# Altium project PSOC.PrjPcb
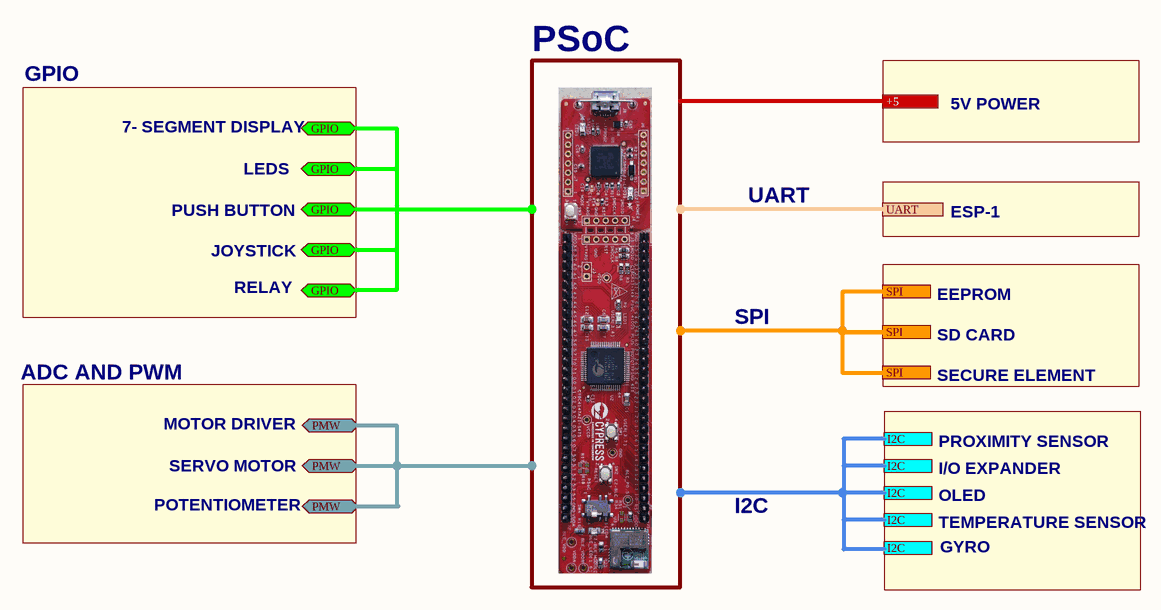
[diagram p0: Block_Diagram.SchDoc]
5 sheets, 139 parts. Net scope: global (net labels, ports and power ports of the same name join across sheets).
Board file: PSOC_LAY.PcbDoc
Sheets:
  Block_Diagram.SchDoc
  PSOC_ControllerSchDoc.SchDoc
  PSOC_I2C_BUS.SchDoc
  PSOC_SPI_BUS.SchDoc
  PSOC_PERI_2.SchDoc

## Sheet Block_Diagram.SchDoc
size A4; SheetNumber: 1; SheetTotal: 7

### Ports
+5, GPIO (bidir, see Block_Diagram[2B]), GPIO (bidir, see Block_Diagram[2B], Block_Diagram[2C]), I2C (see Block_Diagram[3C]), I2C (see Block_Diagram[3C], Block_Diagram[3D]), PMW (bidir, see Block_Diagram[2C]), SPI (see Block_Diagram[3C]), UART

### Notes on the sheet
- GPIO
- PSoC
- 7- SEGMENT DISPLAY
- 5V POWER
- PUSH BUTTON
- LEDS
- UART
- ESP-1
- JOYSTICK
- RELAY
- SPI
- EEPROM
- SD CARD
- ADC AND PWM
- SECURE ELEMENT
- MOTOR DRIVER
- SERVO MOTOR
- PROXIMITY SENSOR
- I/O EXPANDER
- POTENTIOMETER
- I2C
- OLED
- TEMPERATURE SENSOR
- GYRO

## Sheet PSOC_ControllerSchDoc.SchDoc
size A3; SheetNumber: 3; SheetTotal: 7
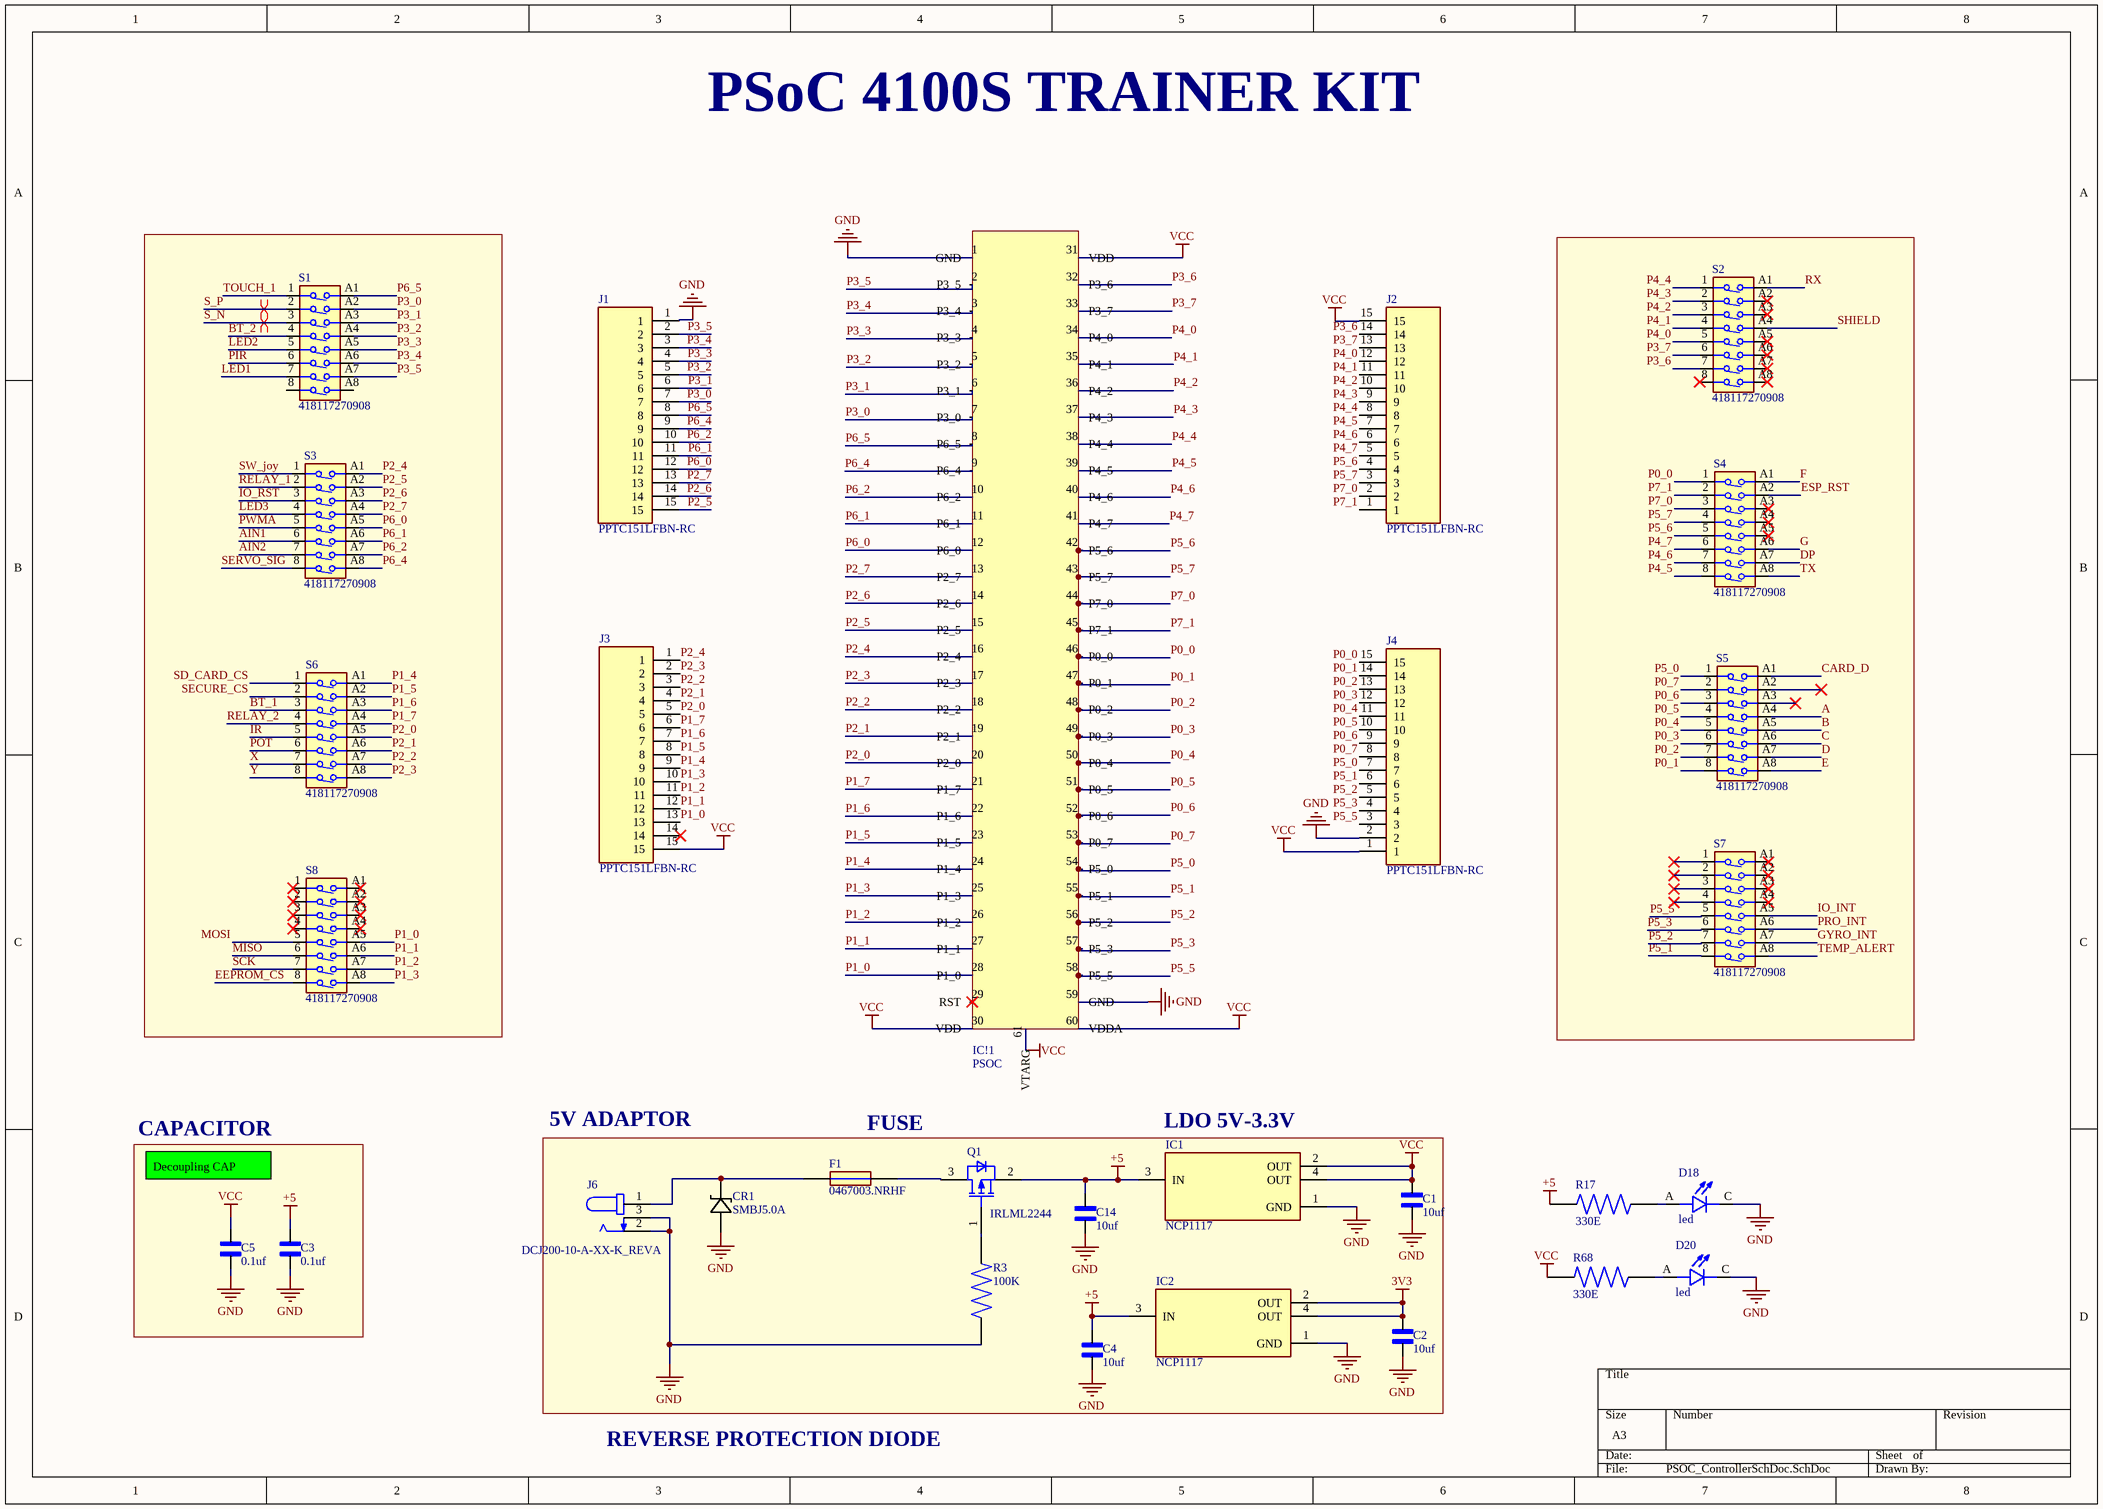
[diagram p1: PSOC_ControllerSchDoc.SchDoc]

### Parts
C1  10uf  [CAPC3216X229N]
C2  10uf  [CAPC3216X229N]
C3  0.1uf  [CAPC1005X55N]
C4  10uf  [CAPC3216X229N]
C5  0.1uf  [CAPC1005X55N]
C14  10uf  [CAPC3216X229N]
CR1  SMBJ5.0A  [DO-214AASMB_J-BEND_LTF]
D18  led  [LEDC2012X120N]
D20  led  [LEDC2012X120N]
F1  0467003.NRHF  [FUSC1608X43N]
IC1  NCP1117  [SOT223-3]
IC2  NCP1117  [SOT223-3]
IC!1  PSOC  [PCBComponent_1]
J1  PPTC151LFBN-RC  [RHDR15W85P0X254_1X15_3708X254X850P]
J2  PPTC151LFBN-RC  [RHDR15W85P0X254_1X15_3708X254X850P]
J3  PPTC151LFBN-RC  [RHDR15W85P0X254_1X15_3708X254X850P]
J4  PPTC151LFBN-RC  [RHDR15W85P0X254_1X15_3708X254X850P]
J6  DCJ200-10-A-XX-K_REVA  [GCT_DCJ200-10-A-XX-K_REVA]
Q1  IRLML2244  [SOT95P230X110-3N]
R3  100K  [RESC1005X40N]
R17  330E  [RESC1005X40N]
R68  330E  [RESC1005X40N]
S1  418117270908  [418117270908]
S2  418117270908  [418117270908]
S3  418117270908  [418117270908]
S4  418117270908  [418117270908]
S5  418117270908  [418117270908]
S6  418117270908  [418117270908]
S7  418117270908  [418117270908]
S8  418117270908  [418117270908]

### Blocks framed on the sheet
CAPACITOR: C3 C5

### Nets
3V3: C2.2 IC2.2(OUT) IC2.4(OUT)
+5: C3.1 C4.2 C14.2 IC1.3(IN) IC2.3(IN) Q1.2(SOURCE) R17.2
GND: C1.1 C2.1 C3.2 C4.1 C5.2 C14.1 CR1.2(ANODE) D18.C D20.C IC1.1(GND) IC2.1(GND) IC!1.1(GND) IC!1.59(GND) J1.1 J4.2 J6.2 J6.3 R3.2
VCC: C1.2 C5.1 IC1.2(OUT) IC1.4(OUT) IC!1.30(VDD) IC!1.31(VDD) IC!1.60(VDDA) IC!1.61(VTARG) J2.15 J3.15 J4.1 R68.2
A: S5.A4
AIN1: S3.6
AIN2: S3.7
B: S5.A5
BT_1: S6.3
BT_2: S1.4
C: S5.A6
CARD_D: S5.A1
D: S5.A7
DP: S4.A7
E: S5.A8
EEPROM_CS: S8.8
ESP_RST: S4.A2
F: S4.A1
G: S4.A6
GYRO_INT: S7.A7
IO_INT: S7.A5
IO_RST: S3.3
IR: S6.5
LED1: S1.7
LED2: S1.5
LED3: S3.4
MISO: S8.6
MOSI: S8.5
P0_0: IC!1.46(P0_0) J4.15 S4.1
P0_1: IC!1.47(P0_1) J4.14 S5.8
P0_2: IC!1.48(P0_2) J4.13 S5.7
P0_3: IC!1.49(P0_3) J4.12 S5.6
P0_4: IC!1.50(P0_4) J4.11 S5.5
P0_5: IC!1.51(P0_5) J4.10 S5.4
P0_6: IC!1.52(P0_6) J4.9 S5.3
P0_7: IC!1.53(P0_7) J4.8 S5.2
P1_0: IC!1.28(P1_0) J3.13 S8.A5
P1_1: IC!1.27(P1_1) J3.12 S8.A6
P1_2: IC!1.26(P1_2) J3.11 S8.A7
P1_3: IC!1.25(P1_3) J3.10 S8.A8
P1_4: IC!1.24(P1_4) J3.9 S6.A1
P1_5: IC!1.23(P1_5) J3.8 S6.A2
P1_6: IC!1.22(P1_6) J3.7 S6.A3
P1_7: IC!1.21(P1_7) J3.6 S6.A4
P2_0: IC!1.20(P2_0) J3.5 S6.A5
P2_1: IC!1.19(P2_1) J3.4 S6.A6
P2_2: IC!1.18(P2_2) J3.3 S6.A7
P2_3: IC!1.17(P2_3) J3.2 S6.A8
P2_4: IC!1.16(P2_4) J3.1 S3.A1
P2_5: IC!1.15(P2_5) J1.15 S3.A2
P2_6: IC!1.14(P2_6) J1.14 S3.A3
P2_7: IC!1.13(P2_7) J1.13 S3.A4
P3_0: IC!1.7(P3_0) J1.7 S1.A2
P3_1: IC!1.6(P3_1) J1.6 S1.A3
P3_2: IC!1.5(P3_2) J1.5 S1.A4
P3_3: IC!1.4(P3_3) J1.4 S1.A5
P3_4: IC!1.3(P3_4) J1.3 S1.A6
P3_5: IC!1.2(P3_5) J1.2 S1.A7
P3_6: IC!1.32(P3_6) J2.14 S2.7
P3_7: IC!1.33(P3_7) J2.13 S2.6
P4_0: IC!1.34(P4_0) J2.12 S2.5
P4_1: IC!1.35(P4_1) J2.11 S2.4
P4_2: IC!1.36(P4_2) J2.10 S2.3
P4_3: IC!1.37(P4_3) J2.9 S2.2
P4_4: IC!1.38(P4_4) J2.8 S2.1
P4_5: IC!1.39(P4_5) J2.7 S4.8
P4_6: IC!1.40(P4_6) J2.6 S4.7
P4_7: IC!1.41(P4_7) J2.5 S4.6
P5_0: IC!1.54(P5_0) J4.7 S5.1
P5_1: IC!1.55(P5_1) J4.6 S7.8
P5_2: IC!1.56(P5_2) J4.5 S7.7
P5_3: IC!1.57(P5_3) J4.4 S7.6
P5_5: IC!1.58(P5_5) J4.3 S7.5
P5_6: IC!1.42(P5_6) J2.4 S4.5
P5_7: IC!1.43(P5_7) J2.3 S4.4
P6_0: IC!1.12(P6_0) J1.12 S3.A5
P6_1: IC!1.11(P6_1) J1.11 S3.A6
P6_2: IC!1.10(P6_2) J1.10 S3.A7
P6_4: IC!1.9(P6_4) J1.9 S3.A8
P6_5: IC!1.8(P6_5) J1.8 S1.A1
P7_0: IC!1.44(P7_0) J2.2 S4.3
P7_1: IC!1.45(P7_1) J2.1 S4.2
PIR: S1.6
POT: S6.6
PRO_INT: S7.A6
PWMA: S3.5
RELAY_1: S3.2
RELAY_2: S6.4
RX: S2.A1
S_N: S1.3
S_P: S1.2
SCK: S8.7
SD_CARD_CS: S6.1
SECURE_CS: S6.2
SERVO_SIG: S3.8
SHIELD: S2.A4
SW_joy: S3.1
TEMP_ALERT: S7.A8
TOUCH_1: S1.1
TX: S4.A8
X: S6.7
Y: S6.8
NetCR1_1: CR1.1(CATHODE) F1.2 J6.1
NetD18_A: D18.A R17.1
NetD20_A: D20.A R68.1
NetF1_1: F1.1 Q1.3(DRAIN)
NetQ1_1: Q1.1(GATE) R3.1

Not connected (* = marked no-connect by the designer): IC!1 29(RST)*; J3 14*; S1 8 A8; S2 8* A2* A3* A5* A6* A7* A8*; S4 A3* A4* A5*; S5 A2* A3*; S7 1* 2* 3* 4* A1* A2* A3* A4*; S8 1* 2* 3* 4* A1* A2* A3* A4*

### Layout directives
differential pair: S_N, S_P

### Notes on the sheet
- PSoC 4100S TRAINER KIT
- 5V ADAPTOR
- Decoupling CAP
- (near F1) FUSE
- (near IC1) LDO 5V-3.3V
- REVERSE PROTECTION DIODE

### Library data of the parts
C1 C2 C4 C14 = 1206ZD226MAT2A: 0,1 ÂµF Â±%10 16V Seramik KondansatÃ¶r X7R 0402 (1005 Metrik); MF: AVX; SnapEDA_Link: https://www.snapeda.com/parts/1206ZD226MAT2A/AVX/view-part/?ref=snap; Package: 3216 AVX; Value: *; MP: 1206ZD226MAT2A; Check_prices: https://www.snapeda.com/parts/1206ZD226MAT2A/AVX/view-part/?ref=eda
C3 C5 = C0402T104K4RACTU: Cap Ceramic 0.1uF 16V X7R 10% SMD 0402 85Â°C Punched Paper T/R; MF: KEMET; SnapEDA_Link: https://www.snapeda.com/parts/C0402T104K4RACTU/KEMET/view-part/?ref=snap; Package: 0402 KEMET; Value: *; MP: C0402T104K4RACTU; Check_prices: https://www.snapeda.com/parts/C0402T104K4RACTU/KEMET/view-part/?ref=eda
CR1 = SMBJ5.0A: Description; Manufacturer_Name: Littelfuse Inc; Copyright: Copyright (C) 2026 Ultra Librarian. All rights reserved.; Manufacturer_Part_Number: SMBJ5.0A
D18 D20 = SML-LXT0805IW-TR: LED;Red;11mcd;0.061In.Dia.;SMD;100mA;2V Vf;635nm;140deg;SMD;White Diffused;5V Vr | Lumex SML-LXT0805IW-TR; MF: Lumex Opto/Components; SnapEDA_Link: https://www.snapeda.com/parts/SML-LXT0805IW-TR/Lumex+Opto%252FComponents+Inc./view-part/?ref=snap; Package: 0805 Lumex; Value: *; MP: SML-LXT0805IW-TR; Check_prices: https://www.snapeda.com/parts/SML-LXT0805IW-TR/Lumex+Opto%252FComponents+Inc./view-part/?ref=eda
F1 = 0467001.NRHF: Surface Mount Fuses 32V 0603 1A V/FA HALIDE FREE; Manufacturer_Name: LITTELFUSE; Geometry.Height: 0.432mm; Mouser Part Number: 576-0467001.NRHF; Mouser Price/Stock: https://www.mouser.co.uk/ProductDetail/Littelfuse/0467001NRHF?qs=n5MbhIql%252BRmX3ko2b0IFNg%3D%3D; Manufacturer_Part_Number: 0467001.NRHF; Datasheet Link: *
IC1 IC2 = NCP1117: Linear Voltage Regulator IC Positive Fixed 1 Output 1A SOT-223; MF: ON Semiconductor; SnapEDA_Link: https://www.snapeda.com/parts/NCP1117/Onsemi/view-part/?ref=snap; Package: None; Value: *; MP: NCP1117; Check_prices: https://www.snapeda.com/parts/NCP1117/Onsemi/view-part/?ref=eda
J1-J4 = PPTC151LFBN-RC: CONN HDR 15POS 0.1 TIN PCB; Manufacturer_Name: Sullins; Geometry.Height: 8.5mm; Manufacturer_Part_Number: PPTC151LFBN-RC; Mouser Part Number: *; Mouser Price/Stock: *; Arrow Part Number: *; Arrow Price/Stock: *; Datasheet Link: https://www.digikey.com/en/products/detail/sullins-connector-solutions/PPTC151LFBN-RC/810153
J6 = DCJ200-10-A-XX-K_REVA: Power Barrel Connector Jack 2.05mm ID (0.081), 5.50mm OD (0.217) Through Hole, Right Angle; MF: Global Connector Technology; MP: DCJ200-10-A-K1-K; SnapEDA_Link: https://www.snapeda.com/parts/DCJ200-10-A-K1-K/Global+Connector+Technology/view-part/?ref=snap; Package: None; Value: *; Check_prices: https://www.snapeda.com/parts/DCJ200-10-A-K1-K/Global+Connector+Technology/view-part/?ref=eda
Q1 = IRLML2244: Insulated-Gate Field-Effect Transistor (IGFET), P-Channel, Enhancement,  Body Diode, Pin 1 Gate, 2 Source, 3 Drain, 3 Pins; Manufacturer: Infineon Technologies; PackageReference: PG-SOT23-3-901; Manufacturer Order Number: IRLML2244
R3 R17 R68 = RL0402FR-070R1L: 100 mOhms Â±1% 0.063W, 1/16W Chip Resistor 0402 (1005 Metric) Automotive AEC-Q200, Current Sense, Moisture Resistant Thick Film; MF: Yageo; SnapEDA_Link: https://www.snapeda.com/parts/RL0402FR-070R1L/Yageo/view-part/?ref=snap; Package: 0402-2 Yageo; Value: *; MP: RL0402FR-070R1L; Check_prices: https://www.snapeda.com/parts/RL0402FR-070R1L/Yageo/view-part/?ref=eda
S1-S8 = 418117270908: Dip Switch SPST 8 Position Through Hole Slide (Standard) Actuator 25mA 24VDC; MF: WÃ¼rth Elektronik; SnapEDA_Link: https://www.snapeda.com/parts/418117270908/W%25C3%25BCrth+Elektronik+Midcom/view-part/?ref=snap; Package: None; Value: *; MP: 418117270908; Check_prices: https://www.snapeda.com/parts/418117270908/W%25C3%25BCrth+Elektronik+Midcom/view-part/?ref=eda

## Sheet PSOC_I2C_BUS.SchDoc
size A3; SheetNumber: 4; SheetTotal: 7
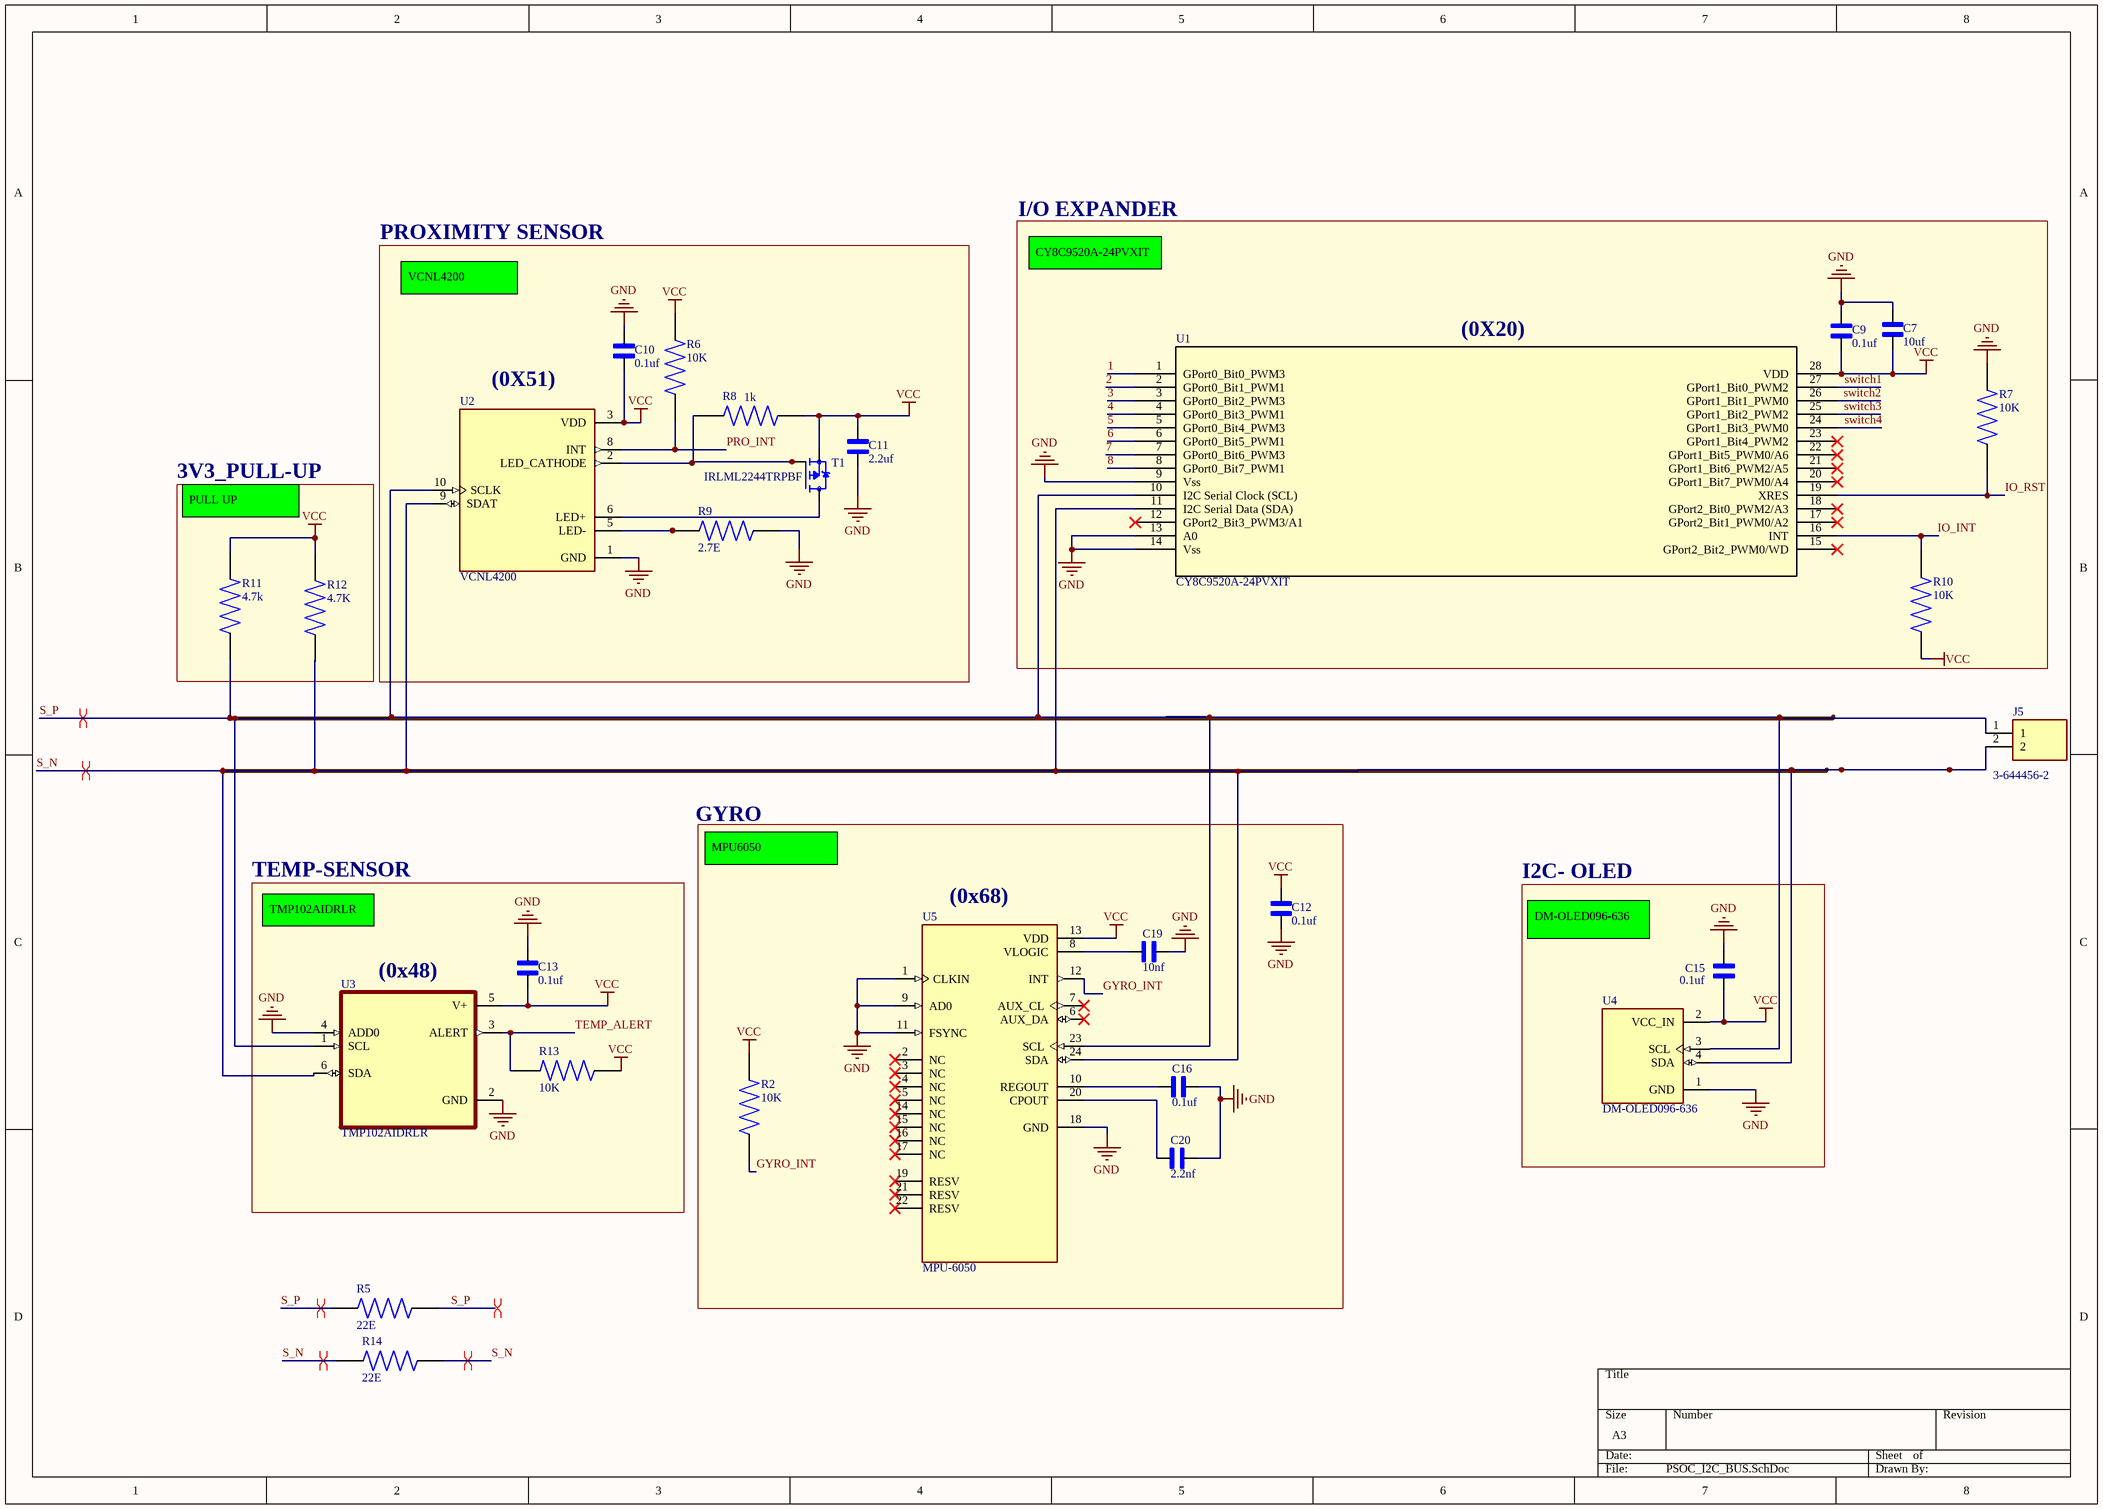
[diagram p2: PSOC_I2C_BUS.SchDoc]

### Parts
C7  10uf  [CAPC3216X229N]
C9  0.1uf  [CAPC1005X55N]
C10  0.1uf  [CAPC1005X55N]
C11  2.2uf  [CAPC1005X55N]
C12  0.1uf  [CAPC1005X55N]
C13  0.1uf  [CAPC1005X55N]
C15  0.1uf  [CAPC1005X55N]
C16  0.1uf  [CAPC1005X55N]
C19  10nf  [CAPC1005X55N]
C20  2.2nf  [CAPC1005X55N]
J5  3-644456-2  [TE_3-644456-2]
R2  10K  [RESC1005X40N]
R5  22E  [RESC1005X40N]
R6  10K  [RESC1005X40N]
R7  10K  [RESC1005X40N]
R8  1k  [RESC1005X40N]
R9  2.7E  [RESC1005X40N]
R10  10K  [RESC1005X40N]
R11  4.7k  [RESC1005X40N]
R12  4.7K  [RESC1005X40N]
R13  10K  [RESC1005X40N]
R14  22E  [RESC1005X40N]
T1  IRLML2244TRPBF  [SOT-23]
U1  CY8C9520A-24PVXIT  [SSOP-28]
U2  VCNL4200  [SENSOR_VCNL4200]
U3  TMP102AIDRLR  [SOT50P160X60-6N]
U4  DM-OLED096-636  [MODULE_DM-OLED096-636]
U5  MPU-6050  [QFN50P400X400X95-24N]

### Blocks framed on the sheet
3V3_PULL-UP: R11 R12
I2C- OLED: C15 U4

### Nets
GND: C7.2 C9.1 C10.1 C11.2 C12.1 C13.1 C15.1 C16.2 C19.2 C20.2 R7.2 R9.2 U1.9(Vss) U1.13(A0) U1.14(Vss) U2.1(GND) U3.2(GND) U3.4(ADD0) U4.1(GND) U5.1(CLKIN) U5.9(AD0) U5.11(FSYNC) U5.18(GND)
VCC: C7.1 C9.2 C10.2 C11.1 C12.2 C13.2 C15.2 R2.2 R6.2 R8.2 R10.1 R11.2 R12.2 R13.2 T1.2(S) U1.28(VDD) U2.3(VDD) U3.5(V+) U4.2(VCC_IN) U5.13(VDD)
1: U1.1(GPort0_Bit0_PWM3)
2: U1.2(GPort0_Bit1_PWM1)
3: U1.3(GPort0_Bit2_PWM3)
4: U1.4(GPort0_Bit3_PWM1)
5: U1.5(GPort0_Bit4_PWM3)
6: U1.6(GPort0_Bit5_PWM1)
7: U1.7(GPort0_Bit6_PWM3)
8: U1.8(GPort0_Bit7_PWM1)
GYRO_INT: R2.1 U5.12(INT)
IO_INT: R10.2 U1.16(INT)
IO_RST: R7.1 U1.19(XRES)
PRO_INT: R6.1 U2.8(INT)
S_N: J5.2 R12.1 R14.1 R14.2 U1.11(I2C_Serial_Data_(SDA)) U2.9(SDAT) U3.6(SDA) U4.4(SDA) U5.24(SDA)
S_P: J5.1 R5.1 R5.2 R11.1 U1.10(I2C_Serial_Clock_(SCL)) U2.10(SCLK) U3.1(SCL) U4.3(SCL) U5.23(SCL)
switch1: U1.27(GPort1_Bit0_PWM2)
switch2: U1.26(GPort1_Bit1_PWM0)
switch3: U1.25(GPort1_Bit2_PWM2)
switch4: U1.24(GPort1_Bit3_PWM0)
TEMP_ALERT: R13.1 U3.3(ALERT)
NetC16_1: C16.1 U5.10(REGOUT)
NetC19_1: C19.1 U5.8(VLOGIC)
NetC20_1: C20.1 U5.20(CPOUT)
NetR8_1: R8.1 T1.1(G) U2.2(LED_CATHODE)
NetR9_1: R9.1 U2.5(LED-)
NetT1_3: T1.3(D) U2.6(LED+)

Not connected (* = marked no-connect by the designer): U1 12(GPort2_Bit3_PWM3/A1)* 15(GPort2_Bit2_PWM0/WD)* 17(GPort2_Bit1_PWM0/A2)* 18(GPort2_Bit0_PWM2/A3)* 20(GPort1_Bit7_PWM0/A4)* 21(GPort1_Bit6_PWM2/A5)* 22(GPort1_Bit5_PWM0/A6)* 23(GPort1_Bit4_PWM2)*; U5 2(NC)* 3(NC)* 4(NC)* 5(NC)* 6(AUX_DA)* 7(AUX_CL)* 14(NC)* 15(NC)* 16(NC)* 17(NC)* 19(RESV)* 21(RESV)* 22(RESV)*

### Layout directives
differential pair: S_N, S_P

### Notes on the sheet
- PROXIMITY SENSOR
- I/O EXPANDER
- VCNL4200
- CY8C9520A-24PVXIT
- (near U1) (0X20)
- (near U2) (0X51)
- PULL UP
- GYRO
- TEMP-SENSOR
- TMP102AIDRLR
- MPU6050
- (near U5) (0x68)
- (near U3) (0x48)
- DM-OLED096-636

### Library data of the parts
C7 = 1206ZD226MAT2A: as C1 on sheet PSOC_ControllerSchDoc; SnapEDA_Link: https://www.snapeda.com/parts/1206ZD226MAT2A/AVX/view-part/?ref=snap; Package: 3216 AVX; Value: *; MP: 1206ZD226MAT2A; Check_prices: https://www.snapeda.com/parts/1206ZD226MAT2A/AVX/view-part/?ref=eda
C9-C13 C15 C16 C19 C20 = C0402T104K4RACTU: as C3 on sheet PSOC_ControllerSchDoc; SnapEDA_Link: https://www.snapeda.com/parts/C0402T104K4RACTU/KEMET/view-part/?ref=snap; Package: 0402 KEMET; Value: *; MP: C0402T104K4RACTU; Check_prices: https://www.snapeda.com/parts/C0402T104K4RACTU/KEMET/view-part/?ref=eda
J5 = 3-644456-2: HEADER ASSEMBLY, NARROW, MTA-100, 2 POSITION, STRAIGHT | TE Connectivity 3-644456-2; SnapEDA_Link: https://www.snapeda.com/parts/3-644456-2/TE+Connectivity+AMP+Connectors/view-part/?ref=snap; Package: None; Value: *; MF: TE Connectivity; MP: 3-644456-2; Check_prices: https://www.snapeda.com/parts/3-644456-2/TE+Connectivity+AMP+Connectors/view-part/?ref=eda
R2 R5-R14 = RL0402FR-070R1L: as R3 on sheet PSOC_ControllerSchDoc; SnapEDA_Link: https://www.snapeda.com/parts/RL0402FR-070R1L/Yageo/view-part/?ref=snap; Package: 0402-2 Yageo; Value: *; MP: RL0402FR-070R1L; Check_prices: https://www.snapeda.com/parts/RL0402FR-070R1L/Yageo/view-part/?ref=eda
T1 = IRLML2244TRPBF: IRLML2244TRPBF P-channel MOSFET Transistor, 4.3 A, 20 V, 3-Pin SOT-23 | Infineon IRLML2244TRPBF; SnapEDA_Link: https://www.snapeda.com/parts/IRLML2244TRPBF/Infineon+Technologies/view-part/?ref=snap; Package: SOT-23-3 ON Semiconductor; Value: *; MF: Infineon; MP: IRLML2244TRPBF; Check_prices: https://www.snapeda.com/parts/IRLML2244TRPBF/Infineon+Technologies/view-part/?ref=eda
U1 = CY8C9520A-24PVXIT: Description; Manufacturer_Name: Cypress Semiconductor; Copyright: Copyright (C) 2026 Ultra Librarian. All rights reserved.; Manufacturer_Part_Number: CY8C9520A-24PVXIT; RefDes: RefDes; Type: Type
U2 = VCNL4200: Optical Sensor Ambient 550nm IÂ²C 10-SMD Module; MF: Vishay Semiconductor; SnapEDA_Link: https://www.snapeda.com/parts/VCNL4200/Vishay%20Semiconductor%20Opto%20Division/view-part/1174507/?ref=snap; Availability: Unavailable; MP: VCNL4200; Price: None; Value: *; Package: SMD-10 Vishay
U3 = TMP102AIDRLR: 2C digital temperature sensor, I2C/SMBus in 2.56mm2 package; MF: Texas Instruments; Check_prices: https://www.snapeda.com/parts/TMP102AIDRLR/Texas+Instruments/view-part/?ref=eda; Value: *; Availability: In Stock; MP: TMP102AIDRLR; Price: None; Package: SOT-5X3-6 Texas Instruments; SnapEDA_Link: https://www.snapeda.com/parts/TMP102AIDRLR/Texas+Instruments/view-part/?ref=snap; Purchase-URL: https://pricing.snapeda.com/search/part/TMP102AIDRLR/?ref=eda
U4 = DM-OLED096-636: 0.96â€ 128 X 64 MONOCHROME GRAPHIC OLED DISPLAY MODULE - I2C; SnapEDA_Link: https://www.snapeda.com/parts/DM-OLED096-636/Display+Module/view-part/?ref=snap; Package: Package; Value: *; MF: Display Module; MP: DM-OLED096-636; Check_prices: https://www.snapeda.com/parts/DM-OLED096-636/Display+Module/view-part/?ref=eda
U5 = MPU-6050: MPU-6050 series Accelerometer, Gyroscope, 3 Axis Sensor Evaluation Board; MF: TDK InvenSense; SnapEDA_Link: https://www.snapeda.com/parts/MPU-6050/TDK+InvenSense/view-part/?ref=snap; Package: QFN-24 InvenSense; Value: *; MP: MPU-6050; Check_prices: https://www.snapeda.com/parts/MPU-6050/TDK+InvenSense/view-part/?ref=eda

## Sheet PSOC_SPI_BUS.SchDoc
size A3; SheetNumber: 5; SheetTotal: 7
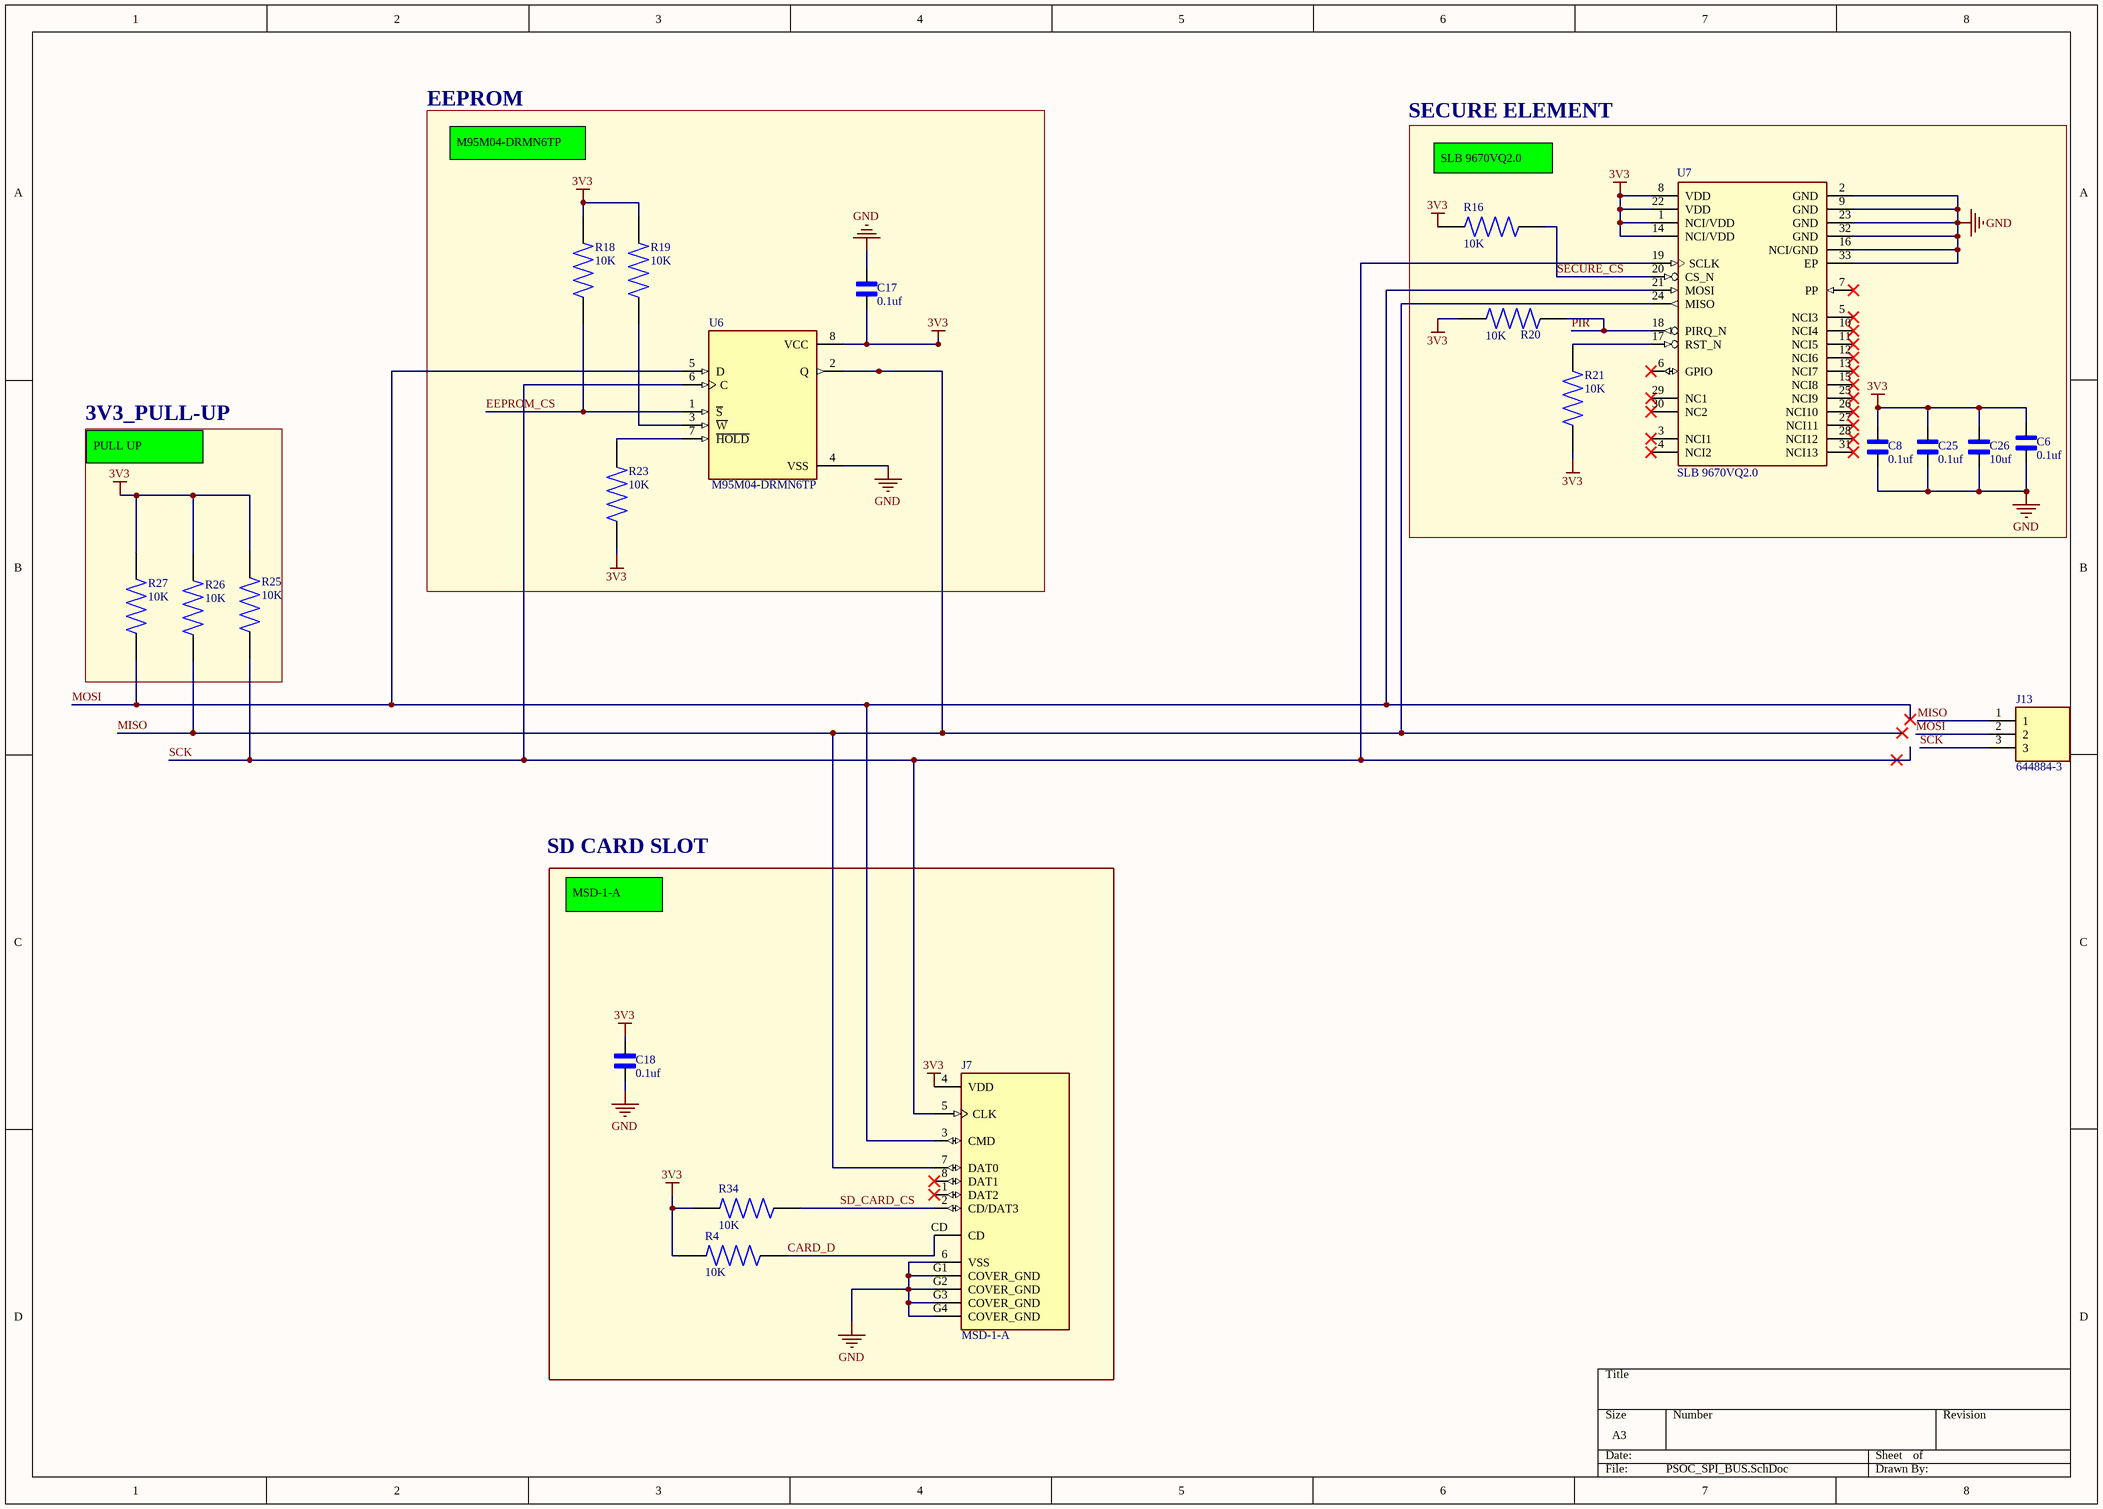
[diagram p3: PSOC_SPI_BUS.SchDoc]

### Parts
C6  0.1uf  [CAPC1005X55N]
C8  0.1uf  [CAPC1005X55N]
C17  0.1uf  [CAPC1005X55N]
C18  0.1uf  [CAPC1005X55N]
C25  0.1uf  [CAPC1005X55N]
C26  10uf  [CAPC3216X229N]
J7  MSD-1-A  [CUI_MSD-1-A]
J13  644884-3  [TE_644884-3]
R4  10K  [RESC1005X40N]
R16  10K  [RESC1005X40N]
R18  10K  [RESC1005X40N]
R19  10K  [RESC1005X40N]
R20  10K  [RESC1005X40N]
R21  10K  [RESC1005X40N]
R23  10K  [RESC1005X40N]
R25  10K  [RESC1005X40N]
R26  10K  [RESC1005X40N]
R27  10K  [RESC1005X40N]
R34  10K  [RESC1005X40N]
U6  M95M04-DRMN6TP  [SOIC127P600X175-8N]
U7  SLB 9670VQ2.0  [QFN50P500X500X90-33N-V]

### Blocks framed on the sheet
EEPROM: C17 R18 R19 R23 U6
SECURE ELEMENT: C6 C8 C25 C26 R16 R20 R21 U7
3V3_PULL-UP: R25-R27
SD CARD SLOT: C18 J7 R4 R34

### Nets
3V3: C6.1 C8.1 C17.2 C18.2 C25.1 C26.2 J7.4(VDD) R4.1 R16.1 R18.2 R19.2 R20.1 R21.1 R23.1 R25.2 R26.2 R27.2 R34.1 U6.8(VCC) U7.1(NCI/VDD) U7.8(VDD) U7.14(NCI/VDD) U7.22(VDD)
GND: C6.2 C8.2 C17.1 C18.1 C25.2 C26.1 J7.6(VSS) J7.G1(COVER_GND) J7.G2(COVER_GND) J7.G3(COVER_GND) J7.G4(COVER_GND) U6.4(VSS) U7.2(GND) U7.9(GND) U7.16(NCI/GND) U7.23(GND) U7.32(GND) U7.33(EP)
CARD_D: J7.CD R4.2
EEPROM_CS: R18.1 U6.1(~{S})
MISO: J7.7(DAT0) J13.1 R26.1 U6.2(Q) U7.24(MISO)
MOSI: J7.3(CMD) J13.2 R27.1 U6.5(D) U7.21(MOSI)
PIR: R20.2 U7.18(PIRQ_N)
SCK: J7.5(CLK) J13.3 R25.1 U6.6(C) U7.19(SCLK)
SD_CARD_CS: J7.2(CD/DAT3) R34.2
SECURE_CS: R16.2 U7.20(CS_N)
NetR19_1: R19.1 U6.3(~{W})
NetR21_2: R21.2 U7.17(RST_N)
NetR23_2: R23.2 U6.7(~{HOLD})

Not connected (* = marked no-connect by the designer): J7 1(DAT2)* 8(DAT1)*; U7 3(NCI1)* 4(NCI2)* 5(NCI3)* 6(GPIO)* 7(PP)* 10(NCI4)* 11(NCI5)* 12(NCI6)* 13(NCI7)* 15(NCI8)* 25(NCI9)* 26(NCI10)* 27(NCI11)* 28(NCI12)* 29(NC1)* 30(NC2)* 31(NCI13)*

### Notes on the sheet
- M95M04-DRMN6TP
- SLB 9670VQ2.0
- PULL UP
- MSD-1-A

### Library data of the parts
C6 C8 C17 C18 C25 = C0402T104K4RACTU: as C3 on sheet PSOC_ControllerSchDoc; SnapEDA_Link: https://www.snapeda.com/parts/C0402T104K4RACTU/KEMET/view-part/?ref=snap; Package: 0402 KEMET; Value: *; MP: C0402T104K4RACTU; Check_prices: https://www.snapeda.com/parts/C0402T104K4RACTU/KEMET/view-part/?ref=eda
C26 = 1206ZD226MAT2A: as C1 on sheet PSOC_ControllerSchDoc; SnapEDA_Link: https://www.snapeda.com/parts/1206ZD226MAT2A/AVX/view-part/?ref=snap; Package: 3216 AVX; Value: *; MP: 1206ZD226MAT2A; Check_prices: https://www.snapeda.com/parts/1206ZD226MAT2A/AVX/view-part/?ref=eda
J7 = MSD-1-A: Micro SD Card Connector, 9 Positions, Connector and Ejector, Push In, Auto Eject Out, Surface Mount, 1.8 mm Height Above Board, Gold Flash; MF: Same Sky; SnapEDA_Link: https://www.snapeda.com/parts/MSD-1-A/Same+Sky/view-part/?ref=snap; Package: None; Value: *; MP: MSD-1-A; Check_prices: https://www.snapeda.com/parts/MSD-1-A/Same+Sky/view-part/?ref=eda
J13 = 644884-3: Conn Unshrouded Header HDR 3 POS 2.54mm Solder ST Thru-Hole Bag/Box; MF: TE Connectivity; SnapEDA_Link: https://www.snapeda.com/parts/644884-3/TE+Connectivity+AMP+Connectors/view-part/?ref=snap; Package: None; Value: *; MP: 644884-3; EU_RoHS_Compliance: Compliant; Check_prices: https://www.snapeda.com/parts/644884-3/TE+Connectivity+AMP+Connectors/view-part/?ref=eda
R4 R16 R18-R21 R23 R25-R27 R34 = RL0402FR-070R1L: as R3 on sheet PSOC_ControllerSchDoc; SnapEDA_Link: https://www.snapeda.com/parts/RL0402FR-070R1L/Yageo/view-part/?ref=snap; Package: 0402-2 Yageo; Value: *; MP: RL0402FR-070R1L; Check_prices: https://www.snapeda.com/parts/RL0402FR-070R1L/Yageo/view-part/?ref=eda
U6 = M95M04-DRMN6TP: EEPROM Memory IC 4Mb (512K x 8) SPI 10 MHz 8-SOIC; MF: STMicroelectronics; SnapEDA_Link: https://www.snapeda.com/parts/M95M04-DRMN6TP/STMicroelectronics/view-part/?ref=snap; Package: None; Value: *; MP: M95M04-DRMN6TP; Check_prices: https://www.snapeda.com/parts/M95M04-DRMN6TP/STMicroelectronics/view-part/?ref=eda
U7 = SLB 9670VQ2.0: OPTIGA™ TPM; Manufacturer: Infineon Technologies; ManufacturerPartNumber: SLB 9670VQ2.0; PackageReference: PG-VQFN-32-13

## Sheet PSOC_PERI_2.SchDoc
size A3; SheetNumber: 7; SheetTotal: 7
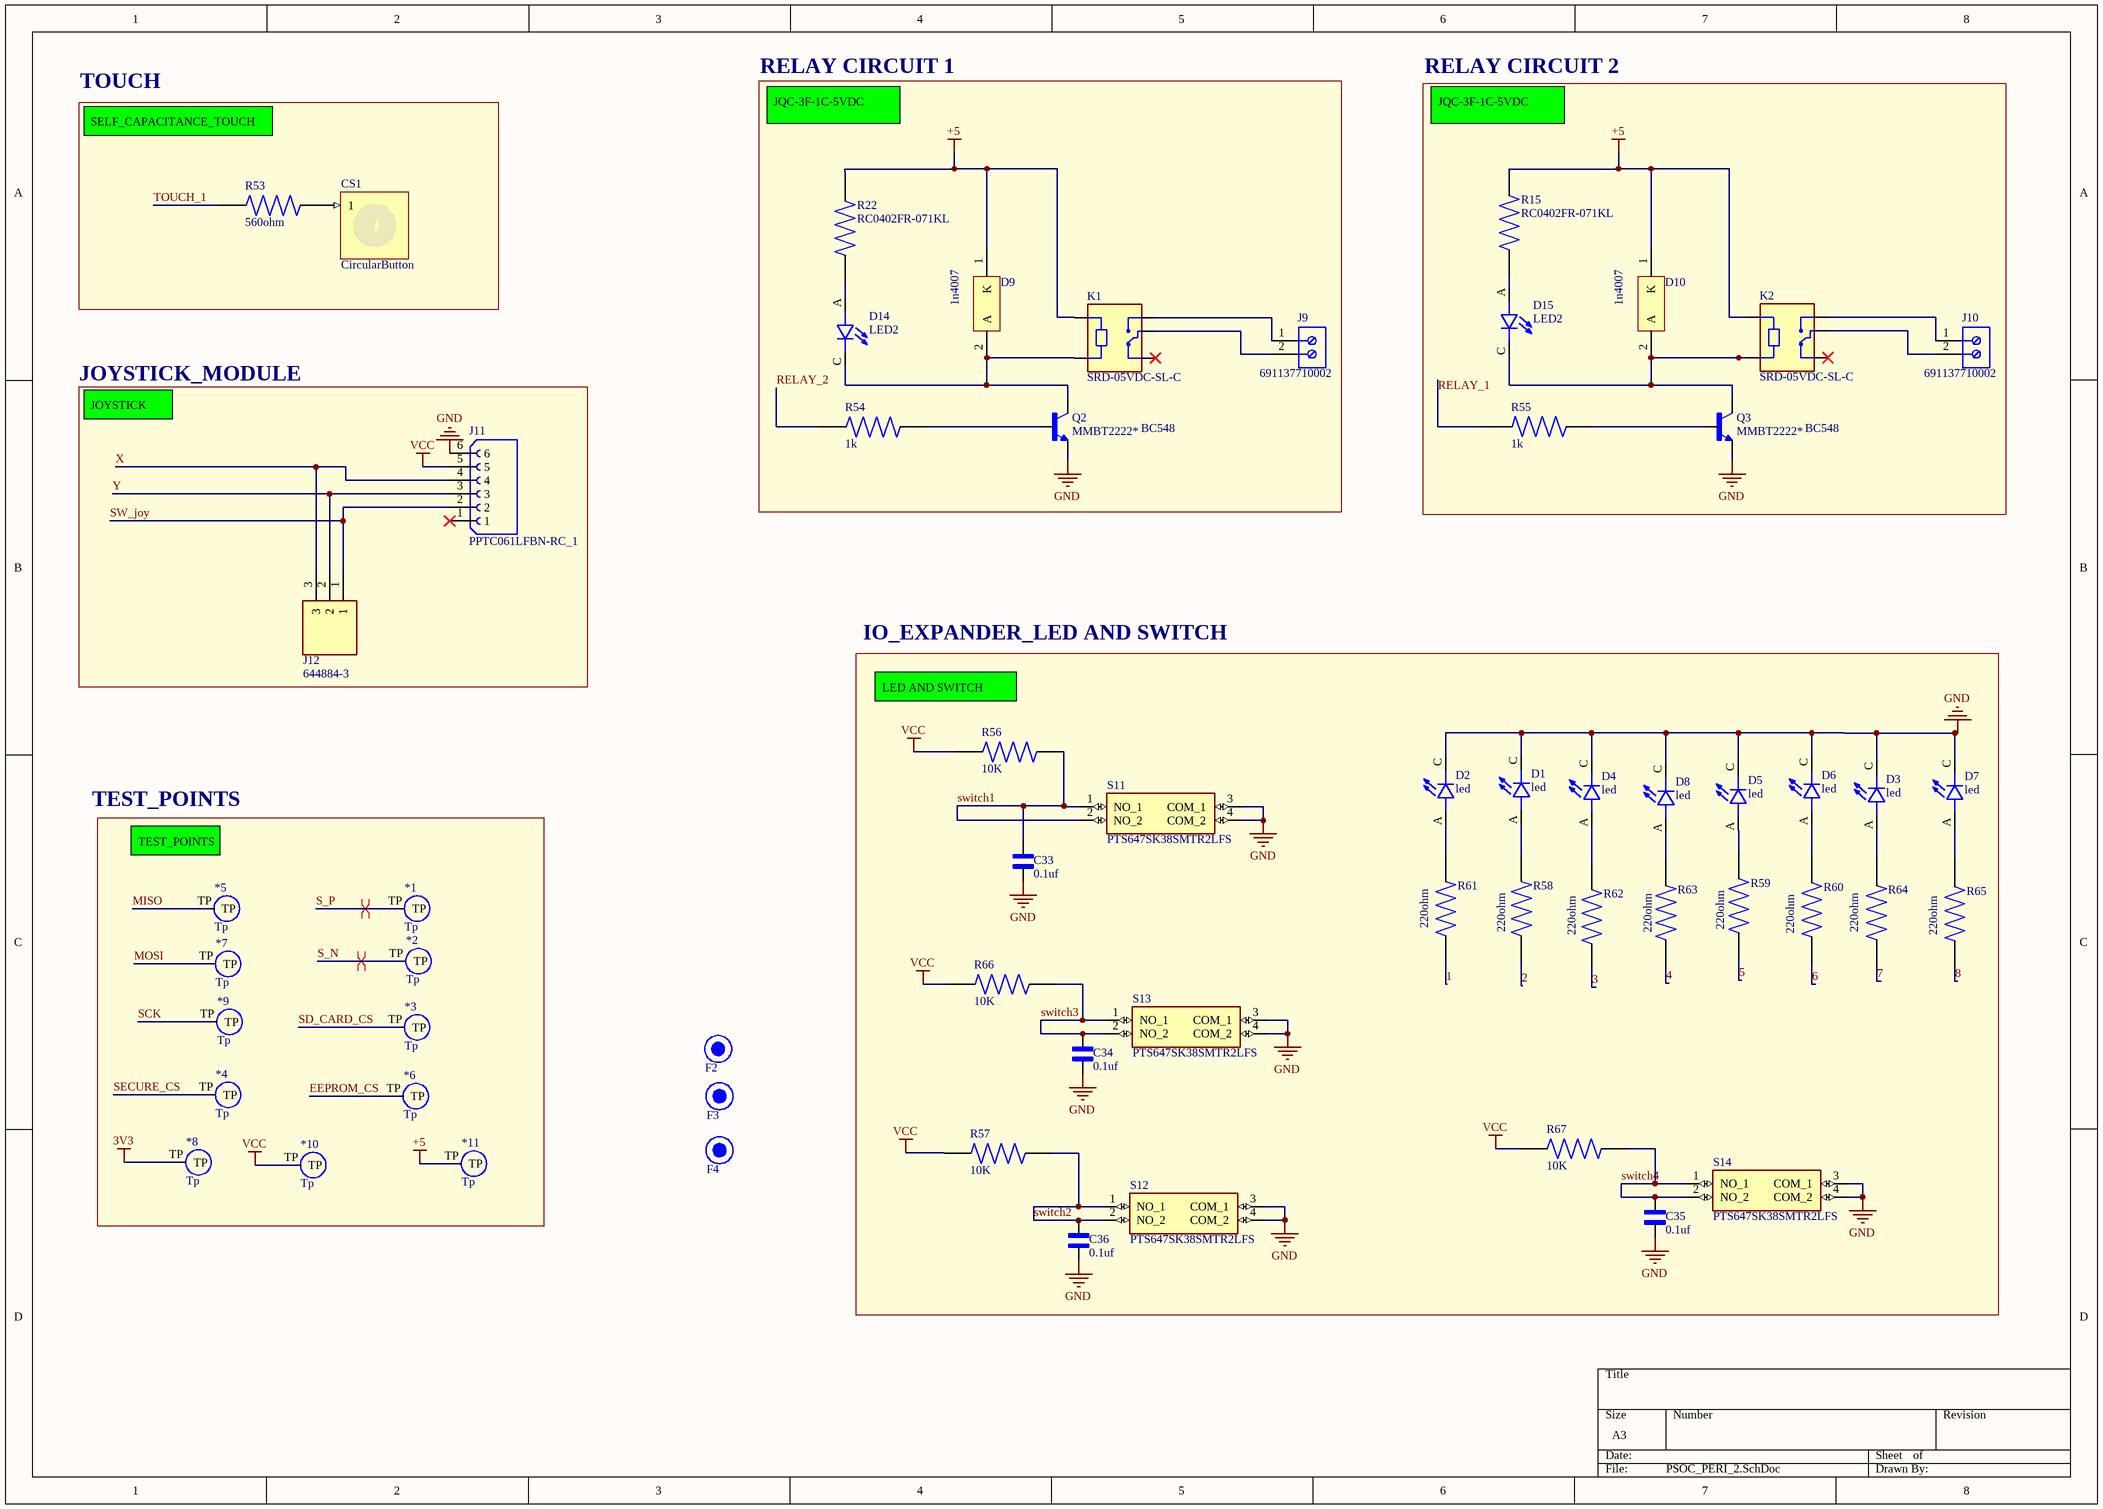
[diagram p4: PSOC_PERI_2.SchDoc]

### Parts
*1  Tp  [TP]
*2  Tp  [TP]
*3  Tp  [TP]
*4  Tp  [TP]
*5  Tp  [TP]
*6  Tp  [TP]
*7  Tp  [TP]
*8  Tp  [TP]
*9  Tp  [TP]
*10  Tp  [TP]
*11  Tp  [TP]
C33  0.1uf  [CAPC1005X55N]
C34  0.1uf  [CAPC1005X55N]
C35  0.1uf  [CAPC1005X55N]
C36  0.1uf  [CAPC1005X55N]
CS1  CircularButton  (no BOM)
D1  led  [LEDC2012X120N]
D2  led  [LEDC2012X120N]
D3  led  [LEDC2012X120N]
D4  led  [LEDC2012X120N]
D5  led  [LEDC2012X120N]
D6  led  [LEDC2012X120N]
D7  led  [LEDC2012X120N]
D8  led  [LEDC2012X120N]
D9  1n4007  [ONSC-AXIAL_LEAD-2-59-10_P]
D10  1n4007  [ONSC-AXIAL_LEAD-2-59-10_P]
D14  LED2  [LEDC2012X120N]
D15  LED2  [LEDC2012X120N]
F2  FIDUCIAL  [FIDUCIAL-1MM]  (value not drawn)
F3  FIDUCIAL  [FIDUCIAL-1MM]  (value not drawn)
F4  FIDUCIAL  [FIDUCIAL-1MM]  (value not drawn)
J9  691137710002  [691137710002]
J10  691137710002  [691137710002]
J11  PPTC061LFBN-RC_1  [SULLINS_PPTC061LFBN-RC]
J12  644884-3  [TE_644884-3]
K1  SRD-05VDC-SL-C  [RELAY_SRD-05VDC-SL-C]
K2  SRD-05VDC-SL-C  [RELAY_SRD-05VDC-SL-C]
Q2  MMBT2222*  [SOT23-BEC]
Q3  MMBT2222*  [SOT23-BEC]
R15  RC0402FR-071KL  [RESC1005X40N]
R22  RC0402FR-071KL  [RESC1005X40N]
R53  560ohm  [RESC1005X40N]
R54  1k  [RESC1005X40N]
R55  1k  [RESC1005X40N]
R56  10K  [RESC1005X40N]
R57  10K  [RESC1005X40N]
R58  220ohm  [RESC1005X40N]
R59  220ohm  [RESC1005X40N]
R60  220ohm  [RESC1005X40N]
R61  220ohm  [RESC1005X40N]
R62  220ohm  [RESC1005X40N]
R63  220ohm  [RESC1005X40N]
R64  220ohm  [RESC1005X40N]
R65  220ohm  [RESC1005X40N]
R66  10K  [RESC1005X40N]
R67  10K  [RESC1005X40N]
S11  PTS647SK38SMTR2LFS  [PTS647SK38SMTR2LFS]
S12  PTS647SK38SMTR2LFS  [PTS647SK38SMTR2LFS]
S13  PTS647SK38SMTR2LFS  [PTS647SK38SMTR2LFS]
S14  PTS647SK38SMTR2LFS  [PTS647SK38SMTR2LFS]

### Blocks framed on the sheet
TOUCH: CS1 R53
RELAY CIRCUIT 1: D9 D14 J9 K1 Q2 R22 R54
RELAY CIRCUIT 2: D10 D15 J10 K2 Q3 R15 R55
JOYSTICK_MODULE: J11 J12
IO_EXPANDER_LED AND SWITCH: C33-C36 D1-D8 R56-R67 S11-S14

### Nets
3V3: *8.TP
+5: *11.TP D9.1(K) D10.1(K) K1.A1 K2.A1 R15.2 R22.2
GND: C33.2 C34.2 C35.2 C36.2 D1.C D2.C D3.C D4.C D5.C D6.C D7.C D8.C J11.6 Q2.E Q3.E S11.3(COM_1) S11.4(COM_2) S12.3(COM_1) S12.4(COM_2) S13.3(COM_1) S13.4(COM_2) S14.3(COM_1) S14.4(COM_2)
VCC: *10.TP J11.5 R56.2 R57.2 R66.2 R67.2
1: R61.1
2: R58.1
3: R62.1
4: R63.1
5: R59.1
6: R60.1
7: R64.1
8: R65.1
EEPROM_CS: *6.TP
MISO: *5.TP
MOSI: *7.TP
RELAY_1: R55.2
RELAY_2: R54.2
S_N: *2.TP
S_P: *1.TP
SCK: *9.TP
SD_CARD_CS: *3.TP
SECURE_CS: *4.TP
SW_joy: J11.2 J12.1
switch1: C33.1 R56.1 S11.1(NO_1) S11.2(NO_2)
switch2: C36.1 R57.1 S12.1(NO_1) S12.2(NO_2)
switch3: C34.1 R66.1 S13.1(NO_1) S13.2(NO_2)
switch4: C35.1 R67.1 S14.1(NO_1) S14.2(NO_2)
TOUCH_1: R53.2
X: J11.4 J12.3
Y: J11.3 J12.2
NetCS1_1: CS1.1 R53.1
NetD1_A: D1.A R58.2
NetD2_A: D2.A R61.2
NetD3_A: D3.A R64.2
NetD4_A: D4.A R62.2
NetD5_A: D5.A R59.2
NetD6_A: D6.A R60.2
NetD7_A: D7.A R65.2
NetD8_A: D8.A R63.2
NetD9_2: D9.2(A) D14.C K1.A2 Q2.C
NetD10_2: D10.2(A) D15.C K2.A2 Q3.C
NetD14_A: D14.A R22.1
NetD15_A: D15.A R15.1
NetJ9_1: J9.1 K1.NO
NetJ9_2: J9.2 K1.COM
NetJ10_1: J10.1 K2.NO
NetJ10_2: J10.2 K2.COM
NetQ2_B: Q2.B R54.1
NetQ3_B: Q3.B R55.1

Not connected (* = marked no-connect by the designer): J11 1*; K1 NC*; K2 NC*

### Layout directives
differential pair: S_N, S_P

### Notes on the sheet
- SELF_CAPACITANCE_TOUCH
- JQC-3F-1C-5VDC
- JOYSTICK
- BC548
- (near R56) LED AND SWITCH
- TEST_POINTS
- Type @ to refer to a designator

### Library data of the parts
C33-C36 = C0402T104K4RACTU: as C3 on sheet PSOC_ControllerSchDoc; SnapEDA_Link: https://www.snapeda.com/parts/C0402T104K4RACTU/KEMET/view-part/?ref=snap; Package: 0402 KEMET; Value: *; MP: C0402T104K4RACTU; Check_prices: https://www.snapeda.com/parts/C0402T104K4RACTU/KEMET/view-part/?ref=eda
CS1 = CircularButton: ConfiguratorName: CYPRESS_TOUCH; ConfigurationParameters: {}__sensorid[CircularButton]{}outerDiameter[10]{}innerDiameter[1]{}
D1-D8 D14 D15 = SML-LXT0805IW-TR: as D18 on sheet PSOC_ControllerSchDoc; SnapEDA_Link: https://www.snapeda.com/parts/SML-LXT0805IW-TR/Lumex+Opto%252FComponents+Inc./view-part/?ref=snap; Package: 0805 Lumex; Value: *; MP: SML-LXT0805IW-TR; Check_prices: https://www.snapeda.com/parts/SML-LXT0805IW-TR/Lumex+Opto%252FComponents+Inc./view-part/?ref=eda
D9 D10 = CMP-0902-00143-1: Standard Recovery Rectifier, 2-Pin Axial_Lead, Pb-Free, Bulk Bag; PartNumber: 1N4007G; Manufacturer: On Semiconductor; VRRM Max (V): 1000; IFSM Max (A): 30; IO(rec) Max (A): 1; ComponentLink2Description: Datasheet; ComponentLink2URL: http://www.onsemi.com/pub_link/Collateral/1N4001-D.PDF; PackageDescription: 2-Pin, Axial Lead, Diameter 2.35 mm; ComponentLink1URL: http://www.onsemi.com/; ComponentLink3URL: http://www.onsemi.cn/pub_link/Collateral/59-10.PDF; PackageReference: AXIAL_LEAD-2-59-10; ComponentLink1Description: Manufacturer URL; Mounting Technology: Through Hole; ComponentLink3Description: Package Specification; Packing: Bulk Bag; PackageVersion: Rev. U, 02/2005; DatasheetVersion: Rev. 13; RoHS: TRUE; Type: Standard Recovery
J9 J10 = CMP-1502-03324-2: NexarPartId: 78871135; Voltage Rating: 300V; Number of Contacts: 2; Current Rating: 16A; Lead Pitch: 5mm; Height: 11.6mm; Packaging: Box; RoHS: Non-Compliant; Contact Material: Nickel, Tin; Max Operating Temperature: 120°C; Number of Pins: 2; Min Operating Temperature: -30°C; Number of Rows: 1
J11 = CMP-002-00228-1: 6 Position Header Connector 0.100 (2.54mm) Through Hole Tin; MF: Sullins Connector; MP: PPTC061LFBN-RC; Value: *; Pins: 6; Design Item ID: PPTC061LFBN-RC_1; SnapEDA_Link: https://www.snapeda.com/parts/PPTC061LFBN-RC/Sullins+Connector+Solutions/view-part/?ref=snap; Component Type: Standard; Check_prices: https://www.snapeda.com/parts/PPTC061LFBN-RC/Sullins+Connector+Solutions/view-part/?ref=eda; Source: Maze_Solver_2_Layer.SCHLIB; Case/Package: None
J12 = 644884-3: as J13 on sheet PSOC_SPI_BUS; SnapEDA_Link: https://www.snapeda.com/parts/644884-3/TE+Connectivity+AMP+Connectors/view-part/?ref=snap; Package: None; Value: *; MP: 644884-3; EU_RoHS_Compliance: Compliant; Check_prices: https://www.snapeda.com/parts/644884-3/TE+Connectivity+AMP+Connectors/view-part/?ref=eda
K1 K2 = SRD-05VDC-SL-C: 5V Trigger Relay Module For Arduino And Raspberry Pi 5V Trigger Relay Module For Arduino And Raspberry Pi; MF: Songle Relay; Check_prices: https://www.snapeda.com/parts/SRD-05VDC-SL-C/Songle+Relay/view-part/?ref=eda; Value: *; Availability: Not in stock; Price: None; Package: NON STANDARD-5 Songle Relay; MP: SRD-05VDC-SL-C; SnapEDA_Link: https://www.snapeda.com/parts/SRD-05VDC-SL-C/Songle+Relay/view-part/?ref=snap
Q2 Q3 = MMBT2222*: Bipolar (BJT) Transistor NPN 30 V 600 mA 250MHz 300 mW Surface Mount SOT-23-3 (TO-236); MF: ON Semiconductor; SnapEDA_Link: https://www.snapeda.com/parts/MMBT2222/Onsemi/view-part/?ref=snap; Package: SOT-23-3 Fairchild Semiconductor; Value: *; MP: MMBT2222; Check_prices: https://www.snapeda.com/parts/MMBT2222/Onsemi/view-part/?ref=eda
R15 R22 = RC0402FR-071KL: 1 kOhms Â±1% 0.063W, 1/16W Chip Resistor 0402 (1005 Metric) Moisture Resistant Thick Film; MF: Yageo Corporation; MP: RC0402FR071KL; SnapEDA_Link: https://www.snapeda.com/parts/RC0402FR071KL/Yageo/view-part/?ref=snap; Package: 0402-2 YAGEO; Value: *; Check_prices: https://www.snapeda.com/parts/RC0402FR071KL/Yageo/view-part/?ref=eda
R53-R67 = RL0402FR-070R1L: as R3 on sheet PSOC_ControllerSchDoc; SnapEDA_Link: https://www.snapeda.com/parts/RL0402FR-070R1L/Yageo/view-part/?ref=snap; Package: 0402-2 Yageo; Value: *; MP: RL0402FR-070R1L; Check_prices: https://www.snapeda.com/parts/RL0402FR-070R1L/Yageo/view-part/?ref=eda
S11-S14 = PTS647SK38SMTR2LFS: Tactile Switch SPST-NO Top Actuated Surface Mount; MF: C&K; SnapEDA_Link: https://www.snapeda.com/parts/PTS%20647%20SK38%20SMTR2%20LFS/C%2526K/view-part/?ref=snap; Package: None; Value: *; MP: PTS 647 SK38 SMTR2 LFS; Check_prices: https://www.snapeda.com/parts/PTS%20647%20SK38%20SMTR2%20LFS/C%2526K/view-part/?ref=eda

## Nets that join several sheets
3V3: PSOC_ControllerSchDoc (C2.2 IC2.2 IC2.4), PSOC_SPI_BUS (23 pins), PSOC_PERI_2 (*8.TP)
+5: PSOC_ControllerSchDoc (7 pins), PSOC_PERI_2 (7 pins)
GND: PSOC_ControllerSchDoc (18 pins), PSOC_I2C_BUS (23 pins), PSOC_SPI_BUS (18 pins), PSOC_PERI_2 (23 pins)
VCC: PSOC_ControllerSchDoc (12 pins), PSOC_I2C_BUS (20 pins), PSOC_PERI_2 (6 pins)
1: PSOC_I2C_BUS (U1.1), PSOC_PERI_2 (R61.1)
2: PSOC_I2C_BUS (U1.2), PSOC_PERI_2 (R58.1)
3: PSOC_I2C_BUS (U1.3), PSOC_PERI_2 (R62.1)
4: PSOC_I2C_BUS (U1.4), PSOC_PERI_2 (R63.1)
5: PSOC_I2C_BUS (U1.5), PSOC_PERI_2 (R59.1)
6: PSOC_I2C_BUS (U1.6), PSOC_PERI_2 (R60.1)
7: PSOC_I2C_BUS (U1.7), PSOC_PERI_2 (R64.1)
8: PSOC_I2C_BUS (U1.8), PSOC_PERI_2 (R65.1)
CARD_D: PSOC_ControllerSchDoc (S5.A1), PSOC_SPI_BUS (J7.CD R4.2)
EEPROM_CS: PSOC_ControllerSchDoc (S8.8), PSOC_SPI_BUS (R18.1 U6.1), PSOC_PERI_2 (*6.TP)
GYRO_INT: PSOC_ControllerSchDoc (S7.A7), PSOC_I2C_BUS (R2.1 U5.12)
IO_INT: PSOC_ControllerSchDoc (S7.A5), PSOC_I2C_BUS (R10.2 U1.16)
IO_RST: PSOC_ControllerSchDoc (S3.3), PSOC_I2C_BUS (R7.1 U1.19)
MISO: PSOC_ControllerSchDoc (S8.6), PSOC_SPI_BUS (5 pins), PSOC_PERI_2 (*5.TP)
MOSI: PSOC_ControllerSchDoc (S8.5), PSOC_SPI_BUS (5 pins), PSOC_PERI_2 (*7.TP)
PIR: PSOC_ControllerSchDoc (S1.6), PSOC_SPI_BUS (R20.2 U7.18)
PRO_INT: PSOC_ControllerSchDoc (S7.A6), PSOC_I2C_BUS (R6.1 U2.8)
RELAY_1: PSOC_ControllerSchDoc (S3.2), PSOC_PERI_2 (R55.2)
RELAY_2: PSOC_ControllerSchDoc (S6.4), PSOC_PERI_2 (R54.2)
S_N: PSOC_ControllerSchDoc (S1.3), PSOC_I2C_BUS (9 pins), PSOC_PERI_2 (*2.TP)
S_P: PSOC_ControllerSchDoc (S1.2), PSOC_I2C_BUS (9 pins), PSOC_PERI_2 (*1.TP)
SCK: PSOC_ControllerSchDoc (S8.7), PSOC_SPI_BUS (5 pins), PSOC_PERI_2 (*9.TP)
SD_CARD_CS: PSOC_ControllerSchDoc (S6.1), PSOC_SPI_BUS (J7.2 R34.2), PSOC_PERI_2 (*3.TP)
SECURE_CS: PSOC_ControllerSchDoc (S6.2), PSOC_SPI_BUS (R16.2 U7.20), PSOC_PERI_2 (*4.TP)
SW_joy: PSOC_ControllerSchDoc (S3.1), PSOC_PERI_2 (J11.2 J12.1)
switch1: PSOC_I2C_BUS (U1.27), PSOC_PERI_2 (C33.1 R56.1 S11.1 S11.2)
switch2: PSOC_I2C_BUS (U1.26), PSOC_PERI_2 (C36.1 R57.1 S12.1 S12.2)
switch3: PSOC_I2C_BUS (U1.25), PSOC_PERI_2 (C34.1 R66.1 S13.1 S13.2)
switch4: PSOC_I2C_BUS (U1.24), PSOC_PERI_2 (C35.1 R67.1 S14.1 S14.2)
TEMP_ALERT: PSOC_ControllerSchDoc (S7.A8), PSOC_I2C_BUS (R13.1 U3.3)
TOUCH_1: PSOC_ControllerSchDoc (S1.1), PSOC_PERI_2 (R53.2)
X: PSOC_ControllerSchDoc (S6.7), PSOC_PERI_2 (J11.4 J12.3)
Y: PSOC_ControllerSchDoc (S6.8), PSOC_PERI_2 (J11.3 J12.2)